# Altium schematic sheet User_IO.SchDoc
size A4; SheetNumber: 5; SheetTotal: 5
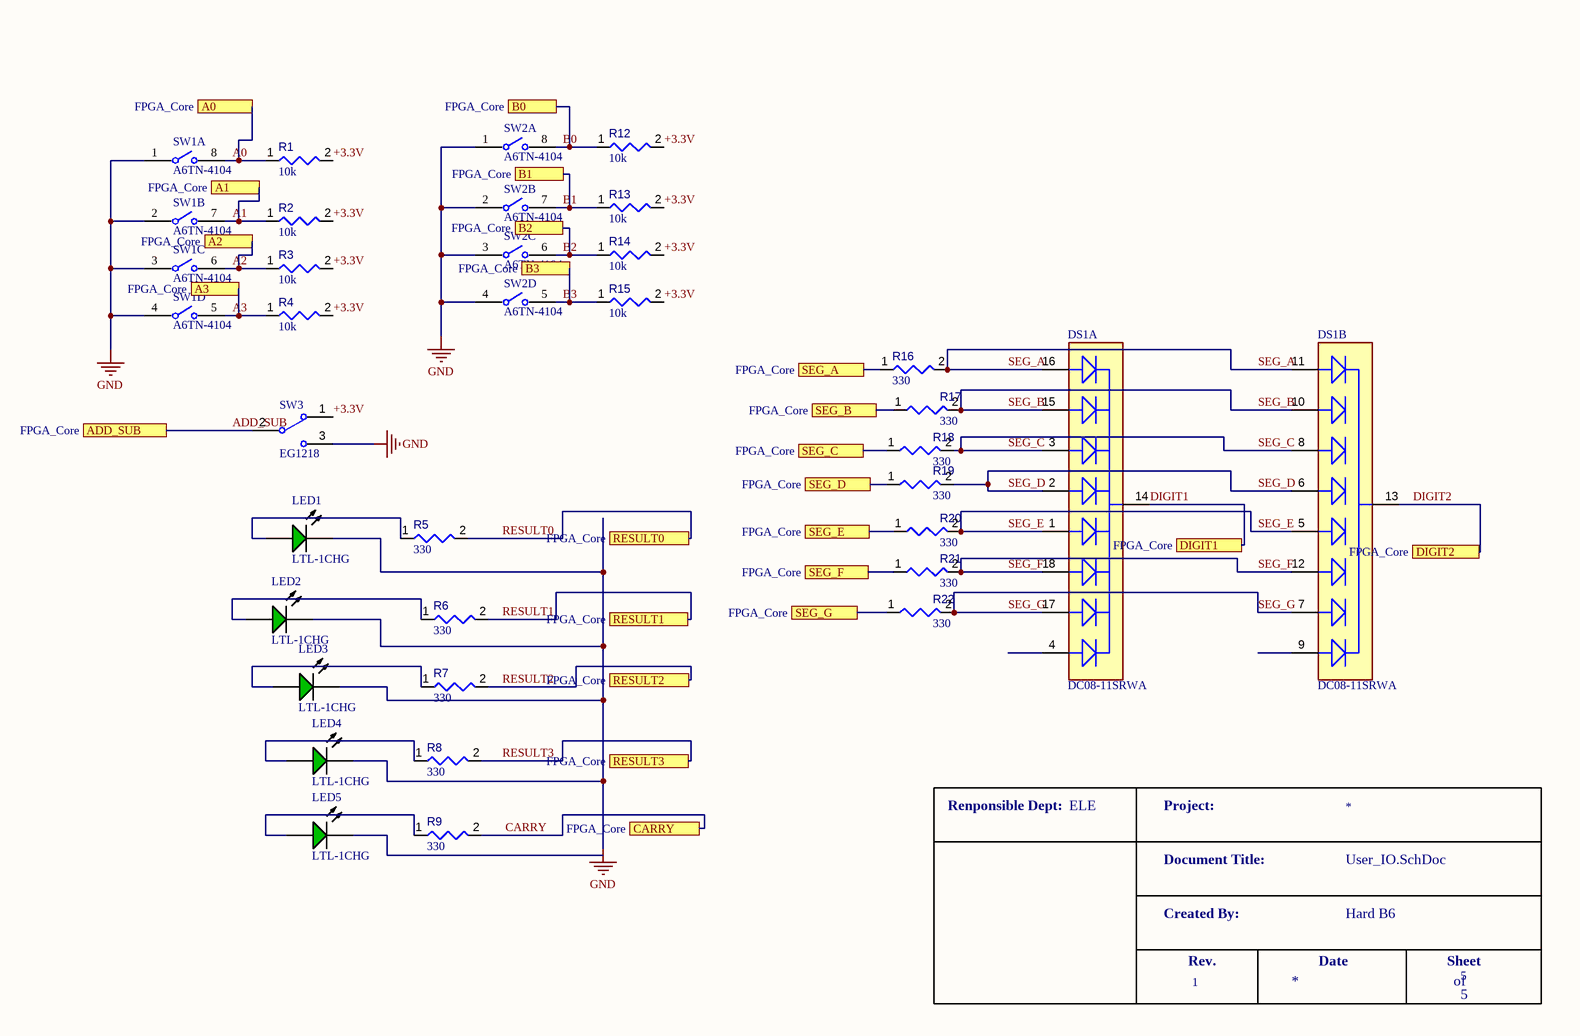
[diagram p0: User_IO.SchDoc]

## Parts
*  HSHL Title Block  (value not drawn)  (graphical)
DS1  DC08-11SRWA  [FP-DC08-11SRWA-MFG]  (parts A,B of 2)
LED1  LTL-1CHG  [LTST-LTL-1CHG-2]
LED2  LTL-1CHG  [LTST-LTL-1CHG-2]
LED3  LTL-1CHG  [LTST-LTL-1CHG-2]
LED4  LTL-1CHG  [LTST-LTL-1CHG-2]
LED5  LTL-1CHG  [LTST-LTL-1CHG-2]
R1  value 10k  [RESC0402(1005)_L]  (hidden comment: Resistor 10K  +/-1 % 0402 63 mW)
R2  value 10k  [RESC0402(1005)_L]  (hidden comment: Resistor 10K  +/-1 % 0402 63 mW)
R3  value 10k  [RESC0402(1005)_L]  (hidden comment: Resistor 10K  +/-1 % 0402 63 mW)
R4  value 10k  [RESC0402(1005)_L]  (hidden comment: Resistor 10K  +/-1 % 0402 63 mW)
R5  value 330  [RESC0402(1005)_L]  (hidden comment: 330R2J)
R6  value 330  [RESC0402(1005)_L]  (hidden comment: 330R2J)
R7  value 330  [RESC0402(1005)_L]  (hidden comment: 330R2J)
R8  value 330  [RESC0402(1005)_L]  (hidden comment: 330R2J)
R9  value 330  [RESC0402(1005)_L]  (hidden comment: 330R2J)
R12  value 10k  [RESC0402(1005)_L]  (hidden comment: Resistor 10K  +/-1 % 0402 63 mW)
R13  value 10k  [RESC0402(1005)_L]  (hidden comment: Resistor 10K  +/-1 % 0402 63 mW)
R14  value 10k  [RESC0402(1005)_L]  (hidden comment: Resistor 10K  +/-1 % 0402 63 mW)
R15  value 10k  [RESC0402(1005)_L]  (hidden comment: Resistor 10K  +/-1 % 0402 63 mW)
R16  value 330  [RESC0402(1005)_L]  (hidden comment: 330R2J)
R17  value 330  [RESC0402(1005)_L]  (hidden comment: 330R2J)
R18  value 330  [RESC0402(1005)_L]  (hidden comment: 330R2J)
R19  value 330  [RESC0402(1005)_L]  (hidden comment: 330R2J)
R20  value 330  [RESC0402(1005)_L]  (hidden comment: 330R2J)
R21  value 330  [RESC0402(1005)_L]  (hidden comment: 330R2J)
R22  value 330  [RESC0402(1005)_L]  (hidden comment: 330R2J)
SW1  A6TN-4104  [FP-A6TN-4104-MFG]  (parts A,B,C,D of 4)
SW2  A6TN-4104  [FP-A6TN-4104-MFG]  (parts A,B,C,D of 4)
SW3  EG1218  [ESWI-EG1218_V]

## Ports
A0 (see FPGA_Core), A1 (see FPGA_Core), A2 (see FPGA_Core), A3 (see FPGA_Core), ADD_SUB (see FPGA_Core), B0 (see FPGA_Core), B1 (see FPGA_Core), B2 (see FPGA_Core), B3 (see FPGA_Core), CARRY (see FPGA_Core), DIGIT1 (see FPGA_Core), DIGIT2 (see FPGA_Core), RESULT0 (see FPGA_Core), RESULT1 (see FPGA_Core), RESULT2 (see FPGA_Core), RESULT3 (see FPGA_Core), SEG_A (see FPGA_Core), SEG_B (see FPGA_Core), SEG_C (see FPGA_Core), SEG_D (see FPGA_Core), SEG_E (see FPGA_Core), SEG_F (see FPGA_Core), SEG_G (see FPGA_Core)

## Nets
GND: LED1.2(K) LED2.2(K) LED3.2(K) LED4.2(K) SW1.1 SW1.2 SW1.3 SW1.4 SW2.1 SW2.2 SW2.3 SW2.4 SW3.3
 CARRY: R9.2 ; port CARRY
+3.3V: R1.2 R2.2 R3.2 R4.2 R12.2 R13.2 R14.2 R15.2 SW3.1
A0: R1.1 SW1.8 ; port A0
A1: R2.1 SW1.7 ; port A1
A2: R3.1 SW1.6 ; port A2
A3: R4.1 SW1.5 ; port A3
ADD_SUB: SW3.2(COM) ; port ADD_SUB
B0: R12.1 SW2.8 ; port B0
B1: R13.1 SW2.7 ; port B1
B2: R14.1 SW2.6 ; port B2
B3: R15.1 SW2.5 ; port B3
DIGIT1: DS1.14(Common_Cathode_Dig1) ; port DIGIT1
DIGIT2: DS1.13(Common_Cathode_Dig2) ; port DIGIT2
RESULT0: R5.2 ; port RESULT0
RESULT1: R6.2 ; port RESULT1
RESULT2: R7.2 ; port RESULT2
RESULT3: R8.2 ; port RESULT3
SEG_A: DS1.11(Anode_a_Dig2) DS1.16(Anode_a_Dig1) R16.2
SEG_A: R16.1 ; port SEG_A  [a separate net that carries the same name]
SEG_B: DS1.10(Anode_b_Dig2) DS1.15(Anode_b_Dig1) R17.2
SEG_B: R17.1 ; port SEG_B  [a separate net that carries the same name]
SEG_C: DS1.3(Anode_c_Dig1) DS1.8(Anode_c_Dig2) R18.2
SEG_C: R18.1 ; port SEG_C  [a separate net that carries the same name]
SEG_D: DS1.2(Anode_d_Dig1) DS1.6(Anode_d_Dig2) R19.2
SEG_D: R19.1 ; port SEG_D  [a separate net that carries the same name]
SEG_E: DS1.1(Anode_e_Dig1) DS1.5(Anode_e_Dig2) R20.2
SEG_E: R20.1 ; port SEG_E  [a separate net that carries the same name]
SEG_F: DS1.12(Anode_f_Dig2) DS1.18(Anode_f_Dig1) R21.2
SEG_F: R21.1 ; port SEG_F  [a separate net that carries the same name]
SEG_G: DS1.7(Anode_g_Dig2) DS1.17(Anode_g_Dig1) R22.2
SEG_G: R22.1 ; port SEG_G  [a separate net that carries the same name]
NetLED1_1: LED1.1(A) R5.1
NetLED2_1: LED2.1(A) R6.1
NetLED3_1: LED3.1(A) R7.1
NetLED4_1: LED4.1(A) R8.1
NetLED5_1: LED5.1(A) R9.1

Not connected (* = marked no-connect by the designer): DS1 4(Anode_Dp1_Dig1) 9(Anode_Dp2_Dig2); LED5 2(K)

## Notes on the sheet
- DWG. NO.
- REV.
- SHT.
- THIS DOCUMENT AND THE DATA DISCLOSED HEREIN OR HEREWITH IS THE PROPERTY OF ALTIUM LIMITED AND MAY BE FREELY DISTRIBUTED IN WHOLE. NO RIGHTS ARE RESERVED OR EXPRESS OR IMPLIED WARANTEE GIVEN.
- REVISION
- DESCRIPTION
- DATE
- APPROVED
- ENG:
- APPROVALS
- PROJECT
- DSN:
- CHK:
- REFERENCE DOCUMENTS
- PROJECT REVISION:
- TITLE
- DOCUMENT REVISION:
- DESIGN ITEM:
- BOM:
- FAB DWG:
- PCB DWG:
- ASSY DWG:
- SCALE:
- SIZE
- B
- CAGE CODE
- FILE NAME
- DWG NO.
- SHEET
- OF
- REV
- (in symbol HSHL Title Block) Renponsible Dept:; ELE; Project:; Document Title:; Created By:; Hard B6; Rev.; Date; Sheet; 1; of

## Library data of the parts
DS1 = CMP-00030-00004-1: 7 Seg Numeric LED Display, 2-Character, Super Bright Red, 20.32mm; Max Operating Temperature: 85°C; Case/Package: DIP; Min Operating Temperature: -40°C
LED1-LED5 = CMP-007-00019-2: LED Uni-Color Green, 100 mW, 30 mA, -55 to 100 degC, 2-Pin THD, RoHS, Bulk; Manufacturer: Lite-On; Power: 100mW; Forward Voltage: 2.6V; Forward Current: 30mA; Nominal Vf: 2.1V; Lens Style: Dome; Viewing Angle: 60degrees; Luminous Intensity: 12.6mcd; Max Operating Temperature: 100°C; Case/Package: Radial; Package Reference: LTL-1CHG; Manufacturer URL: http://www.us.liteon.com/; Package Quantity: 1000; Colour: Green; Packaging: Bulk; RoHS Compliant: True; Datasheet URL: http://datasheet.octopart.com/LTL-1CHG-Lite-On-datasheet-143841.pdf; Package Description: 2-Pin Through Hole Device, Dia 3.8 mm; Min Operating Temperature: -55°C; Mounting Technology: TH; Pins: 2; Illumination Colour: Green; Datasheet Version: Mar-00
R1-R4 R12-R15 = CMP-009-00149-3: Chip Resistor, 10 kOhms, +/-1 %, 63 mW, -55 to 125 degC, 0402; Power: 63mW; Tolerance: 1%; Min Operating Temperature: -55°C; Case/Package: 0402; Max Operating Temperature: 155°C; Pins: 2
R5-R9 R16-R22 = CMP-009-00095-2: 330R 0.063W 5% 0402 (1005 Metric)  SMD; Power: 63mW; Tolerance: 5%; Mounting Technology: SMT; Case/Package: 0402; Pins: 2
SW1 SW2 = CMP-08827-000057-1: SWITCH SLIDE DIP SPST 25MA 24V; Actuator Length: 1mm; Washable: Yes; Number of Positions: 4; Actuator Type: Slide (Standard); Pitch: 0.1inch; Electrical Life: 1000Cycles; Contact Resistance: 200mR; Min Operating Temperature: -30°C; Max Voltage Rating (DC): 24V; Orientation: Straight; Series: A6TN; Max Operating Temperature: 85°C; Weight: 0.58g; Voltage Rating (DC): 24V; Current Rating: 25mA; RoHS Compliant: Yes; Number of Circuits: 4; Package Quantity: 35; Packaging: Rail/Tube; Mount: Through Hole; Throw Configuration: SPST; Termination: PC Pins; Length: 0.476inch; Terminal Pitch: 2.54mm; Max Current Rating: 25mA
SW3 = CMP-011-00006-2: Slide Switch, SPDT, 500 V, -20 to 70 degC, 3-Pin THD, RoHS, Bulk; Manufacturer: E-Switch; Voltage Rating (DC): 30V; Current Rating: 200mA; Operating Force: 250gf; Package Quantity: 1000; Contact Plating: Silver; Max Operating Temperature: 70°C; Min Operating Temperature: -20°C; Contact Material: Copper; Datasheet URL: https://www.e-switch.com/system/asset/product_line/data_sheet/119/EG.pdf; Contact Finish: Silver; Case/Package: EG1218; Voltage Rating (AC): 30V; Datasheet Version: Oct-15; Package Description: 3-Pin Through Hole Device, Body 11.6 x 4 mm, Pitch 2.5 mm; RoHS Compliant: True; Package Reference: EG1218; Manufacturer URL: http://www.e-switch.ch/en/; Throw Configuration: SPDT; Contact Current Rating: 200mA; Mounting Technology: TH; Packaging: Bulk; Pins: 3